# Altium project personal_trng_double_sided.PrjPcb
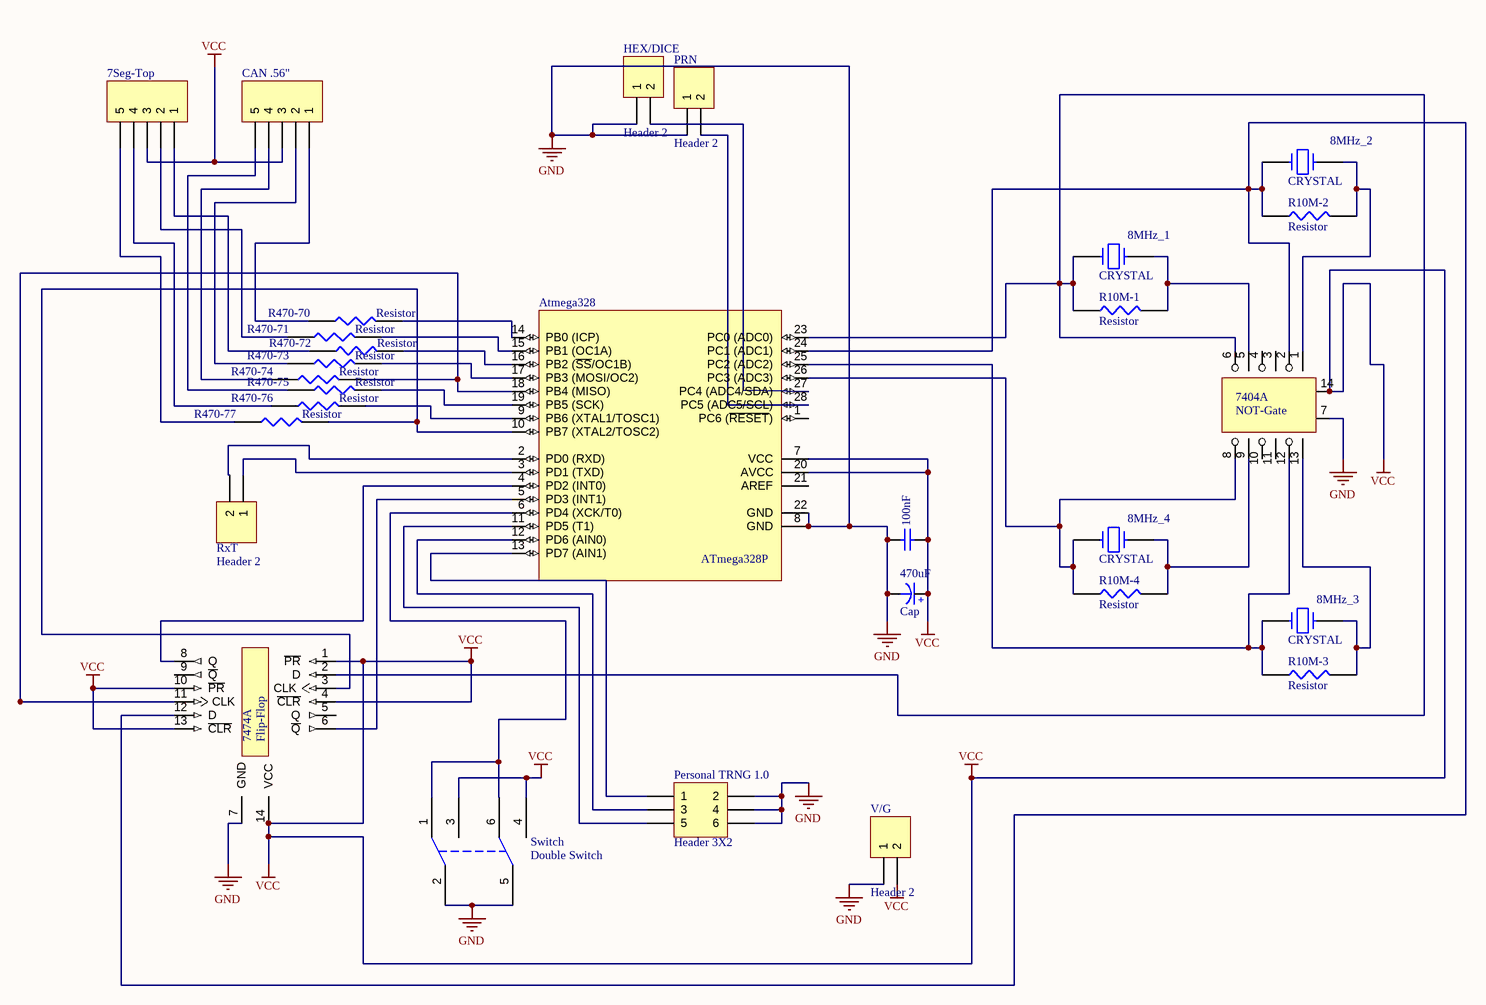
[diagram p0: personal_trng_double_sided.SchDoc]
1 sheet, 29 parts. Net scope: global (net labels, ports and power ports of the same name join across sheets).
Board file: personal_trng_double_sided.PcbDoc

## Sheet personal_trng_double_sided.SchDoc
size 420 x 297 mm; Engineer: shahiN Noursalehi; SheetNumber: 1; SheetTotal: 1; SPICEModelCacheMDWEOOPD: <root> / <DocumentId>MDWEOOPD</DocumentId> / </root>

### Parts
7Seg-Top  Header 5  [My_1X05]  (value not drawn)
8MHz_1  CRYSTAL  [My_Crystal]
8MHz_2  CRYSTAL  [My_Crystal]
8MHz_3  CRYSTAL  [My_Crystal]
8MHz_4  CRYSTAL  [My_Crystal]
100nF  Cap  [My_cap100n]  (value not drawn)
470uF  Cap  [cap 01]
7404  NOT-Gate  [dip14]  (part A of 6)
7474  Flip-Flop  [dip14]  (part A of 3)
Atmega328  ATmega328P  [My_28P3]
CAN_.56"  Header 5  [My_1X05]  (value not drawn)
HEX/DICE  Header 2  [HDR1X2]
Personal_TRNG_1.0  Header 3X2  [HDR2X3]
PRN  Header 2  [HDR1X2]
R10M-1  value Resistor  [My_axial-0.4]  (hidden comment: 1k)
R10M-2  value Resistor  [My_axial-0.4]  (hidden comment: 1k)
R10M-3  value Resistor  [My_axial-0.4]  (hidden comment: 1k)
R10M-4  value Resistor  [My_axial-0.4]  (hidden comment: 1k)
R470-70  value Resistor  [My_axial-0.4]  (hidden comment: 220)
R470-71  value Resistor  [My_axial-0.4]  (hidden comment: 220)
R470-72  value Resistor  [My_axial-0.4]  (hidden comment: 220)
R470-73  value Resistor  [My_axial-0.4]  (hidden comment: 220)
R470-74  value Resistor  [My_axial-0.4]  (hidden comment: 220)
R470-75  value Resistor  [My_axial-0.4]  (hidden comment: 220)
R470-76  value Resistor  [My_axial-0.4]  (hidden comment: 220)
R470-77  value Resistor  [My_axial-0.4]  (hidden comment: 220)
RxT  Header 2  [HDR1X2]
Switch  Double Switch  [Switch - DPDT]
V/G  Header 2  [HDR1X2]

### Nets
GND: 100nF.1 470uF.2(-) 7404.7(GND) 7474.7(GND) Atmega328.8(GND) Atmega328.22(GND) HEX/DICE.1 Personal_TRNG_1.0.2 Personal_TRNG_1.0.4 Personal_TRNG_1.0.6 PRN.1 Switch.2 Switch.5 V/G.1
VCC: 7Seg-Top.3 100nF.2 470uF.1(+) 7404.14(VCC) 7474.1(~{PR}) 7474.4(~{CLR}) 7474.10(~{PR}) 7474.13(~{CLR}) 7474.14(VCC) Atmega328.7(VCC) Atmega328.20(AVCC) CAN_.56".3 Switch.3 Switch.4 V/G.2
Net7Seg-Top_1: 7Seg-Top.1 R470-72.1
Net7Seg-Top_2: 7Seg-Top.2 R470-71.1
Net7Seg-Top_4: 7Seg-Top.4 R470-76.1
Net7Seg-Top_5: 7Seg-Top.5 R470-77.1
Net8MHz_1_1: 8MHz_1.1 7404.6 7474.2(D) Atmega328.23(PC0_(ADC0)) R10M-1.1
Net8MHz_1_2: 8MHz_1.2 7404.5 R10M-1.2
Net8MHz_2_1: 8MHz_2.1 7404.2 7474.12(D) Atmega328.24(PC1_(ADC1)) R10M-2.1
Net8MHz_2_2: 8MHz_2.2 7404.1 R10M-2.2
Net8MHz_3_1: 8MHz_3.1 7404.12 Atmega328.25(PC2_(ADC2)) R10M-3.1
Net8MHz_3_2: 8MHz_3.2 7404.13 R10M-3.2
Net8MHz_4_1: 8MHz_4.1 7404.8 Atmega328.26(PC3_(ADC3)) R10M-4.1
Net8MHz_4_2: 8MHz_4.2 7404.9 R10M-4.2
Net7474_3: 7474.3(CLK) Atmega328.10(PB7_(XTAL2/TOSC2)) R470-77.2
Net7474_6: 7474.6(~{Q}) Atmega328.5(PD3_(INT1))
Net7474_8: 7474.8(Q) Atmega328.4(PD2_(INT0))
Net7474_11: 7474.11(CLK) Atmega328.18(PB4_(MISO)) R470-74.2
NetAtmega328_2: Atmega328.2(PD0_(RXD)) RxT.2
NetAtmega328_3: Atmega328.3(PD1_(TXD)) RxT.1
NetAtmega328_6: Atmega328.6(PD4_(XCK/T0)) Switch.1 Switch.6
NetAtmega328_9: Atmega328.9(PB6_(XTAL1/TOSC1)) R470-76.2
NetAtmega328_11: Atmega328.11(PD5_(T1)) Personal_TRNG_1.0.5
NetAtmega328_12: Atmega328.12(PD6_(AIN0)) Personal_TRNG_1.0.3
NetAtmega328_13: Atmega328.13(PD7_(AIN1)) Personal_TRNG_1.0.1
NetAtmega328_14: Atmega328.14(PB0_(ICP)) R470-70.2
NetAtmega328_15: Atmega328.15(PB1_(OC1A)) R470-71.2
NetAtmega328_16: Atmega328.16(PB2_(~{SS}/OC1B)) R470-72.2
NetAtmega328_17: Atmega328.17(PB3_(MOSI/OC2)) R470-73.2
NetAtmega328_19: Atmega328.19(PB5_(SCK)) R470-75.2
NetAtmega328_27: Atmega328.27(PC4_(ADC4/SDA)) HEX/DICE.2
NetAtmega328_28: Atmega328.28(PC5_(ADC5/SCL)) PRN.2
NetCAN_.56"_1: CAN_.56".1 R470-70.1
NetCAN_.56"_2: CAN_.56".2 R470-73.1
NetCAN_.56"_4: CAN_.56".4 R470-74.1
NetCAN_.56"_5: CAN_.56".5 R470-75.1

Not connected (* = marked no-connect by the designer): 7404 3 4 10 11; 7474 5(Q) 9(~{Q}); Atmega328 1(PC6_(~{RESET})) 21(AREF)

### Notes on the sheet
- THIS DOCUMENT AND THE DATA DISCLOSED HEREIN OR
- HEREWITH IS THE PROPERTY OF ALTIUM LIMITED AND MAY
- DWG NO:
- REVISION
- REV:
- DESCRIPTION
- DATE
- APPROVED
- BE FREELY DISTRIBUTED IN WHOLE. NO RIGHTS ARE
- RESERVED OR EXPRESS OR IMPLIED WARANTEE GIVEN.
- ENG:
- APPROVALS
- PROJECT
- DSN:
- CHK:
- REFERENCE DOCUMENTS
- PROJECT REVISION:
- TITLE
- DOCUMENT REVISION:
- DESIGN ITEM:
- BOM:
- FAB DWG:
- PCB DWG:
- ASSY DWG:
- SCALE:
- A3
- SIZE
- CAGE CODE
- FILE NAME
- DWG NO.
- SHEET
- OF
- REV

### Library data of the parts
7Seg-Top CAN_.56" = Header 5: Header, 5-Pin; LatestRevisionDate: 17-Jul-2002; LatestRevisionNote: Re-released for DXP Platform.; Publisher: Altium Limited
100nF = Cap ceramic: CAP-100Nf; Value: 100nF
470uF = Cap-Polar: Polar Capacitor; Designer: Saeid Jorablo; Organazation: ControTec; Adding Date: 1387/12/20; Value: Cap
7404 = SN7404: Hex Inverter; Manufactorer: Texas Instrument; Designer: Saeid Jorablo; Company: ControTec; Adding Date: 1387/12/22; ComponentLink1Description: Data Sheet; ComponentLink1URL: *
7474 = SN7474N: Dual D Flip Flop; Manufactorer: Texas Instrument; Designer: Saeid Jorablo; Company: ControTec; Adding Date: 1387/12/22; ComponentLink1Description: Data Sheet; ComponentLink1URL: *
Atmega328 = ATmega8-16PI: AVR 8K Bytes of In-System Programmable Flash Memory; Published: 17-Sep-2003; LatestRevisionDate: 04-Mar-2005; LatestRevisionNote: Stylized 3D Model Added.; DatasheetVersion: 2486H-AVR-09/02; PackageVersion: revB, Sep-2001; PackageReference: 28P3; Publisher: Altium Limited; PackageDescription: DIP; 28 Leads; Row Spacing 7.62 mm; Pitch 2.54 mm; ComponentLink1Description: Manufacturer Link; ComponentLink1URL: http://www.atmel.com; ComponentLink2Description: Datasheet; ComponentLink2URL: http://www.atmel.com/dyn/resources/prod_documents/doc2486.pdf
HEX/DICE PRN RxT V/G = Header 2: Header, 2-Pin; LatestRevisionDate: 17-Jul-2002; LatestRevisionNote: Re-released for DXP Platform.; Publisher: Altium Limited
Personal_TRNG_1.0 = Header 3X2: Header, 3-Pin, Dual row; LatestRevisionDate: 17-Jul-2002; LatestRevisionNote: Re-released for DXP Platform.; Publisher: Altium Limited
R10M-1-R10M-4 R470-70-R470-77 = Res: resistor 1/4 wat
Switch = Switch - DPDT: DPDT Switch